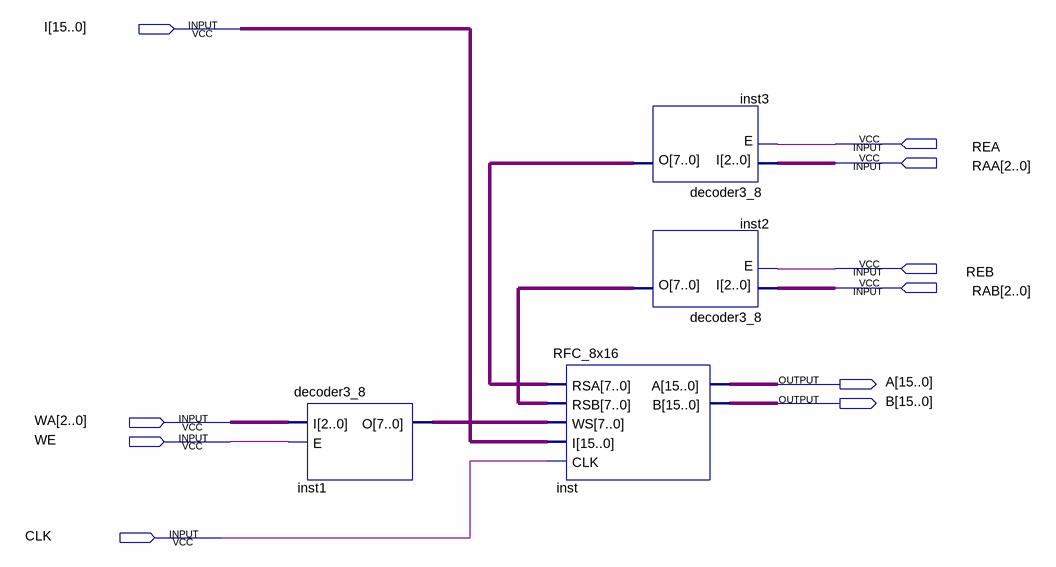
[diagram p0: schematic sheet]
// Quartus schematic reg_file_8_16bit.bdf as structural Verilog: 4 symbols, 10 pins
module reg_file_8_16bit (
  input  [15:0] I,
  input  REA,
  input  [2:0] RAA,
  input  REB,
  input  [2:0] RAB,
  input  [2:0] WA,
  input  WE,
  input  CLK,
  output [15:0] A,
  output [15:0] B
);

  wire [7:0] inst1_o, inst2_o, inst3_o;

  decoder3_8 inst1 (.I(WA), .E(WE), .O(inst1_o));
  RFC_8x16 inst (.RSA(inst3_o), .RSB(inst2_o), .WS(inst1_o), .I(I), .CLK(CLK), .A(A), .B(B));
  decoder3_8 inst3 (.I(RAA), .E(REA), .O(inst3_o));
  decoder3_8 inst2 (.I(RAB), .E(REB), .O(inst2_o));
endmodule
